# EasyEDA schematic schematic.json
TITLE: Sheet_1; REV: 1.0; Date: 2026-11-07; Sheet: 1/1; Drawn By: Farouk; Company: Your Company
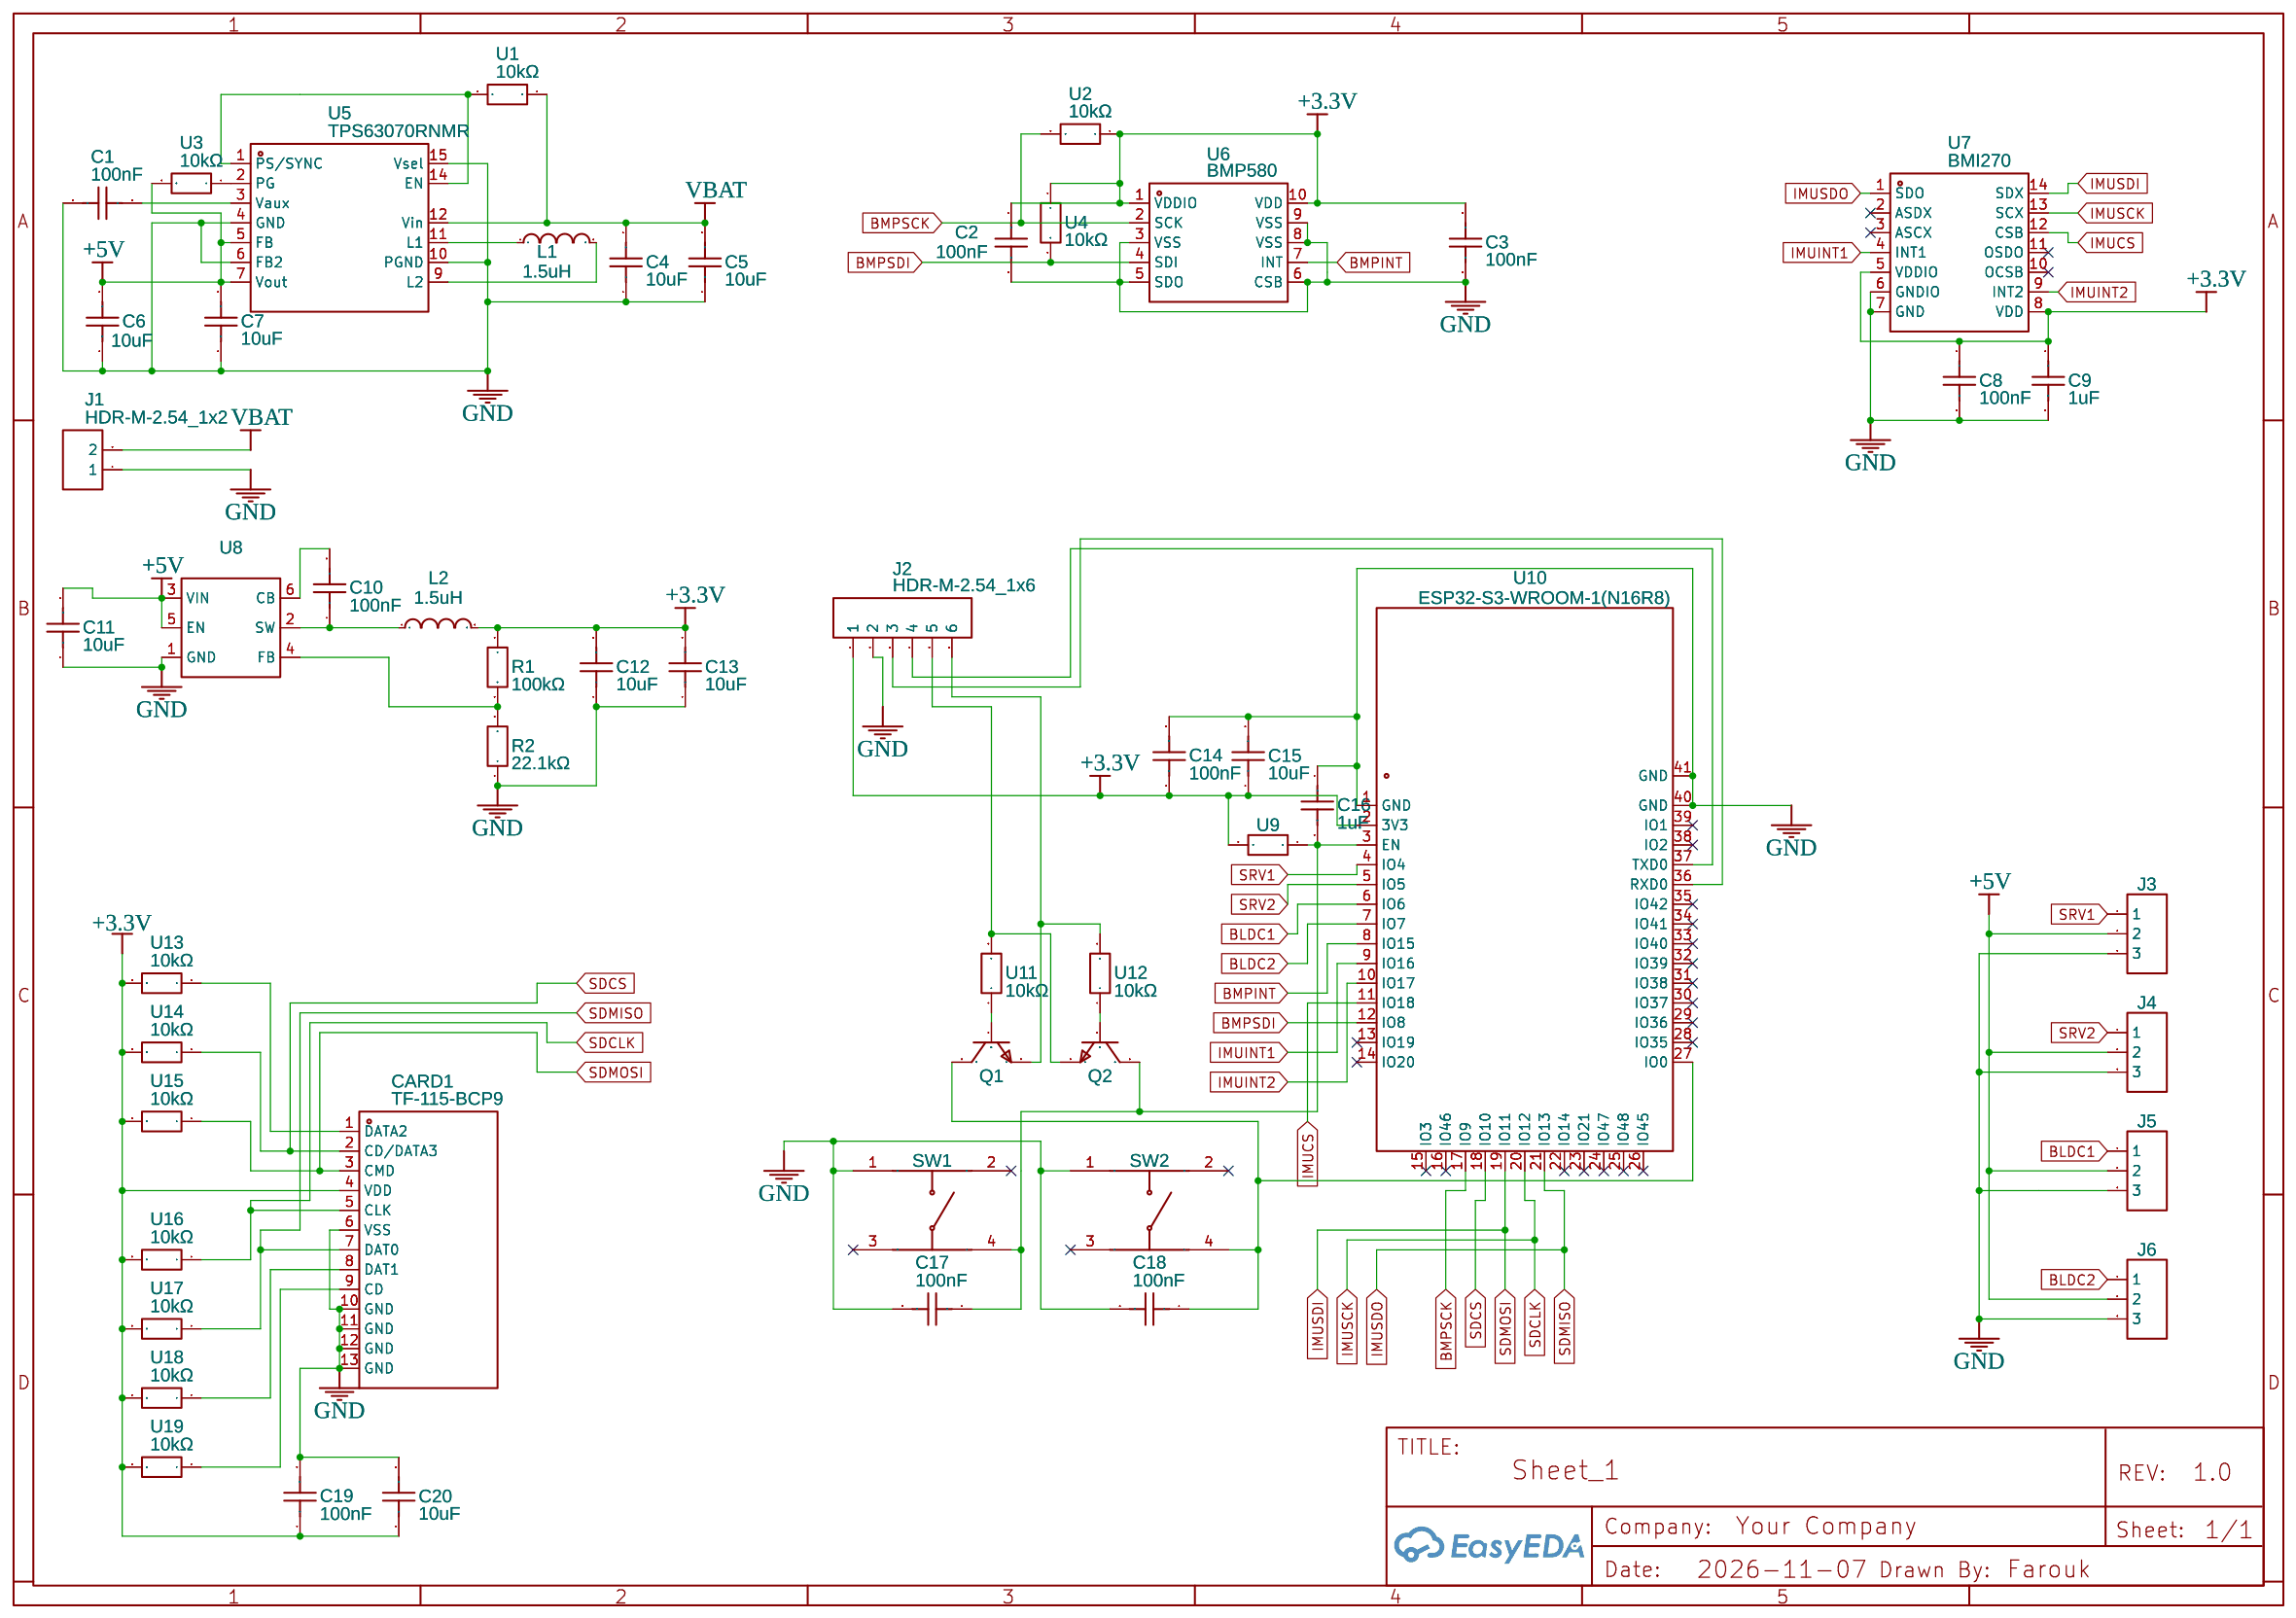
[diagram p0: schematic sheet]

## Parts
C1  100nF  [C0805]
C2  100nF  [C0805]
C3  100nF  [C0805]
C4  10uF  [C0805]
C5  10uF  [C0805]
C6  10uF  [C0805]
C7  10uF  [C0805]
C8  100nF  [C0805]
C9  1uF  [CAP-TH_L5.8-W3.6-P5.0-D0.6]
C10  100nF  [C0805]
C11  10uF  [C0805]
C12  10uF  [C0805]
C13  10uF  [C0805]
C14  100nF  [C0805]
C15  10uF  [C0805]
C16  1uF  [CAP-TH_L5.8-W3.6-P5.0-D0.6]
C17  100nF  [C0805]
C18  100nF  [C0805]
C19  100nF  [C0805]
C20  10uF  [C0805]
CARD1  TF-115-BCP9  [TF-SMD_TF-115-BCP9]
J1  HDR-M-2.54_1x2  [HDR-M-2.54_1X2]
J2  HDR-M-2.54_1x6  [HDR-M-2.54_1X6]
J3  HDR-M-2.54_1x3  [HDR-M-2.54_1X3]
J4  HDR-M-2.54_1x3  [HDR-M-2.54_1X3]
J5  HDR-M-2.54_1x3  [HDR-M-2.54_1X3]
J6  HDR-M-2.54_1x3  [HDR-M-2.54_1X3]
L1  1.5uH  [IND-SMD_L7.0-W6.6]
L2  1.5uH  [IND-SMD_L7.0-W6.6]
Q1  L8050QLT1G  [SOT-23-3_L2.9-W1.3-P1.90-LS2.4-BR]
Q2  L8050QLT1G  [SOT-23-3_L2.9-W1.3-P1.90-LS2.4-BR]
R1  100kΩ  [R0805]
R2  22.1kΩ  [R0805]
SW1  RKCGG140GSMTRLFS  [SW-SMD_4P-L3.0-W2.6-P1.80-LS3.5]
SW2  RKCGG140GSMTRLFS  [SW-SMD_4P-L3.0-W2.6-P1.80-LS3.5]
U1  10kΩ  [R0805]
U2  10kΩ  [R0805]
U3  10kΩ  [R0805]
U4  10kΩ  [R0805]
U5  TPS63070RNMR  [VQFN-15_L3.0-W2.5-P0.50-BL]
U6  BMP580  [LGA-10_L2.0-W2.0-P0.50-TL_BMP580]
U7  BMI270  [LGA-14_L3.0-W2.5-P0.50-BR]
U8  LMR51430XDDCR  [SOT-23-6_L2.9-W1.6-P0.95-LS2.8-BL]
U9  10kΩ  [R0805]
U10  ESP32-S3-WROOM-1(N16R8)  [WIRELM-SMD_ESP32-S3-WROOM-1]
U11  10kΩ  [R0805]
U12  10kΩ  [R0805]
U13  10kΩ  [R0805]
U14  10kΩ  [R0805]
U15  10kΩ  [R0805]
U16  10kΩ  [R0805]
U17  10kΩ  [R0805]
U18  10kΩ  [R0805]
U19  10kΩ  [R0805]

## Library data of the parts
C1-C3 C8 C10 C14 C17-C19 = C0805B104K500NT: Contributor: LCSC; Supplier: LCSC; Supplier Part: C476766; Manufacturer: TORCH(火炬); JLCPCB Part Class: Extended Part
C4-C7 C11-C13 C15 C20 = GRM21BR61C106KE15L: Supplier: LCSC; Manufacturer: muRata(村田); Supplier Part: C77075; JLCPCB Part Class: Extended Part
C9 C16 = 178MU0005: Supplier: LCSC; Supplier Part: C5632429; Manufacturer: KNSCHA(科尼盛); JLCPCB Part Class: Extended Part; Contributor: lcsc
CARD1 = TF-115-BCP9: Contributor: LCSC; Supplier: LCSC; Supplier Part: C720505; Manufacturer: XUNPU(讯普); JLCPCB Part Class: Extended Part
J1 = HDR-M-2.54_1x2: Supplier Part: C124375; Supplier: LCSC; Contributor: LCEDA_Lib
J2 = HDR-M-2.54_1x6: Supplier Part: C190819; Supplier: LCSC; Contributor: LCEDA_Lib
J3-J6 = HDR-M-2.54_1x3: Supplier Part: C180248; Supplier: LCSC; Contributor: LCEDA_Lib
L1 L2 = FXL0630-1R5-M: Contributor: LCSC; Supplier: LCSC; Supplier Part: C167217; Manufacturer: cjiang(长江微电); JLCPCB Part Class: Extended Part
Q1 Q2 = L8050QLT1G: Supplier: LCSC; Manufacturer: LRC(乐山无线电); Supplier Part: C49581; JLCPCB Part Class: Extended Part
R1 = HRC0805J104 FNTN: Supplier: LCSC; Supplier Part: C54921247; Manufacturer: HC(华橙熊猫); JLCPCB Part Class: Extended Part; Contributor: lcsc
R2 = FRC0805F2212TS: Supplier: LCSC; Supplier Part: C2930182; Manufacturer: FOJAN(富捷); JLCPCB Part Class: Extended Part; Contributor: lcsc
SW1 SW2 = RKCGG140GSMTRLFS: Contributor: LCSC; Supplier: LCSC; Supplier Part: C2927791; Manufacturer: C&K; JLCPCB Part Class: Extended Part
U1-U4 U9 U11-U19 = FRC0805F1002TS: Supplier: LCSC; Supplier Part: C2907219; Manufacturer: FOJAN(富捷); JLCPCB Part Class: Extended Part; Contributor: lcsc
U5 = TPS63070RNMR: Supplier: LCSC; Manufacturer: TI(德州仪器); Supplier Part: C109322; JLCPCB Part Class: Extended Part
U6 = BMP580: Supplier: LCSC; Supplier Part: C22391138; Manufacturer: Bosch(博世); JLCPCB Part Class: Extended Part; Contributor: lcsc
U7 = BMI270: Contributor: LCSC; Supplier: LCSC; Supplier Part: C2836813; Manufacturer: Bosch(博世); JLCPCB Part Class: Extended Part
U8 = LMR51430XDDCR: Contributor: lcsc; Supplier: LCSC; Supplier Part: C5185863; Manufacturer: TI(德州仪器); JLCPCB Part Class: Extended Part
U10 = ESP32-S3-WROOM-1(N16R8): Contributor: lcsc; Supplier: LCSC; Supplier Part: C2913202; Manufacturer: ESPRESSIF(乐鑫); Manufacturer Part: ESP32-S3-WROOM-1-N16R8; JLCPCB Part Class: Extended Part

## Nets
+3.3V: C2.1 C3.1 C8.1 C9.1 C12.2 C13.2 C14.1 C15.1 C19.1 C20.1 CARD1.4(VDD) J2.1 L2.2 R1.1 U2.1 U4.1 U6.1(VDDIO) U6.10(VDD) U7.5(VDDIO) U7.8(VDD) U9.2 U10.2(3V3) U13.2 U14.2 U15.2 U16.2 U17.2 U18.2 U19.2
+5V: C6.2 C7.2 C11.2 J3.2 J4.2 J5.2 J6.2 U3.2 U5.5(FB) U5.7(Vout) U8.3(VIN) U8.5(EN)
GND: C1.1 C2.2 C3.2 C4.1 C5.1 C6.1 C7.1 C8.2 C9.2 C11.1 C12.1 C13.1 C14.2 C15.2 C16.1 C17.2 C18.2 C19.2 C20.2 CARD1.6(VSS) CARD1.10(GND) CARD1.11(GND) CARD1.12(GND) CARD1.13(GND) J1.1 J2.2 J3.3 J4.3 J5.3 J6.3 R2.1 SW1.1 SW2.1 U5.4(GND) U5.6(FB2) U5.10(PGND) U5.15(Vsel) U6.3(VSS) U6.5(SDO) U6.6(CSB) U6.8(VSS) U6.9(VSS) U7.6(GNDIO) U7.7(GND) U8.1(GND) U10.1(GND) U10.40(GND) U10.41(GND)
VBAT: C4.2 C5.2 J1.2 U1.1 U5.12(Vin)
BLDC1: J5.1 U10.6(IO6)
BLDC2: J6.1 U10.7(IO7)
BMPINT: U6.7(INT) U10.8(IO15)
BMPSCK: U2.2 U6.2(SCK) U10.17(IO9)
BMPSDI: U4.2 U6.4(SDI) U10.12(IO8)
IMUCS: U7.12(CSB) U10.11(IO18)
IMUINT1: U7.4(INT1) U10.9(IO16)
IMUINT2: U7.9(INT2) U10.10(IO17)
IMUSCK: CARD1.5(CLK) U7.13(SCX) U10.20(IO12) U16.1
IMUSDI: CARD1.3(CMD) U7.14(SDX) U10.19(IO11) U15.1
IMUSDO: CARD1.7(DAT0) U7.1(SDO) U10.21(IO13) U17.1
SDCS: CARD1.2(CD/DATA3) U10.18(IO10) U14.1
SRV1: J3.1 U10.4(IO4)
SRV2: J4.1 U10.5(IO5)
Net-(C1-2): C1.2 U5.3(Vaux)
Net-(C10-1): C10.1 L2.1 U8.2(SW)
Net-(C10-2): C10.2 U8.6(CB)
Net-(C16-2): C16.2 C17.1 Q2.3(C) SW1.4 U9.1 U10.3(EN)
Net-(C18-1): C18.1 Q1.3(C) SW2.4 U10.27(IO0)
Net-(CARD1-1): CARD1.1(DATA2) U13.1
Net-(CARD1-8): CARD1.8(DAT1) U18.1
Net-(CARD1-9): CARD1.9(CD) U19.1
Net-(J2-3): J2.3 U10.36(RXD0)
Net-(J2-4): J2.4 U10.37(TXD0)
Net-(J2-5): J2.5 Q2.2(E) U11.2
Net-(J2-6): J2.6 Q1.2(E) U12.2
Net-(L1-1): L1.1 U5.11(L1)
Net-(L1-2): L1.2 U5.9(L2)
Net-(Q1-1): Q1.1(B) U11.1
Net-(Q2-1): Q2.1(B) U12.1
Net-(R1-2): R1.2 R2.2 U8.4(FB)
Net-(U1-2): U1.2 U5.1(PS/SYNC) U5.14(EN)
Net-(U3-1): U3.1 U5.2(PG)

Not connected (* = marked no-connect by the designer): SW1 2* 3*; SW2 2* 3*; U7 2(ASDX)* 3(ASCX)* 10(OCSB)* 11(OSDO)*; U10 13(IO19)* 14(IO20)* 15(IO3)* 16(IO46)* 22(IO14)* 23(IO21)* 24(IO47)* 25(IO48)* 26(IO45)* 28(IO35)* 29(IO36)* 30(IO37)* 31(IO38)* 32(IO39)* 33(IO40)* 34(IO41)* 35(IO42)* 38(IO2)* 39(IO1)*
